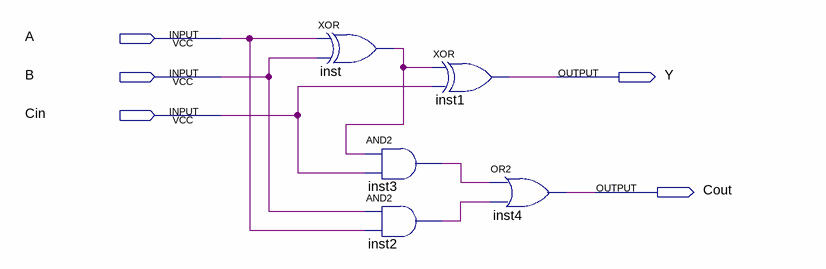
[diagram p0: schematic sheet]
// Quartus schematic FA_1b.bdf as structural Verilog: 5 symbols, 5 pins
module FA_1b (
  input  A,
  input  B,
  input  Cin,
  output Y,
  output Cout
);

  wire inst2_out, inst3_out, inst_out;

  xor inst (inst_out, A, B);
  and inst3 (inst3_out, inst_out, Cin);
  and inst2 (inst2_out, B, A);
  xor inst1 (Y, inst_out, Cin);
  or inst4 (Cout, inst3_out, inst2_out);
endmodule
